# Altium project STM32N6 ETHERNET SWITCH.PrjPcb
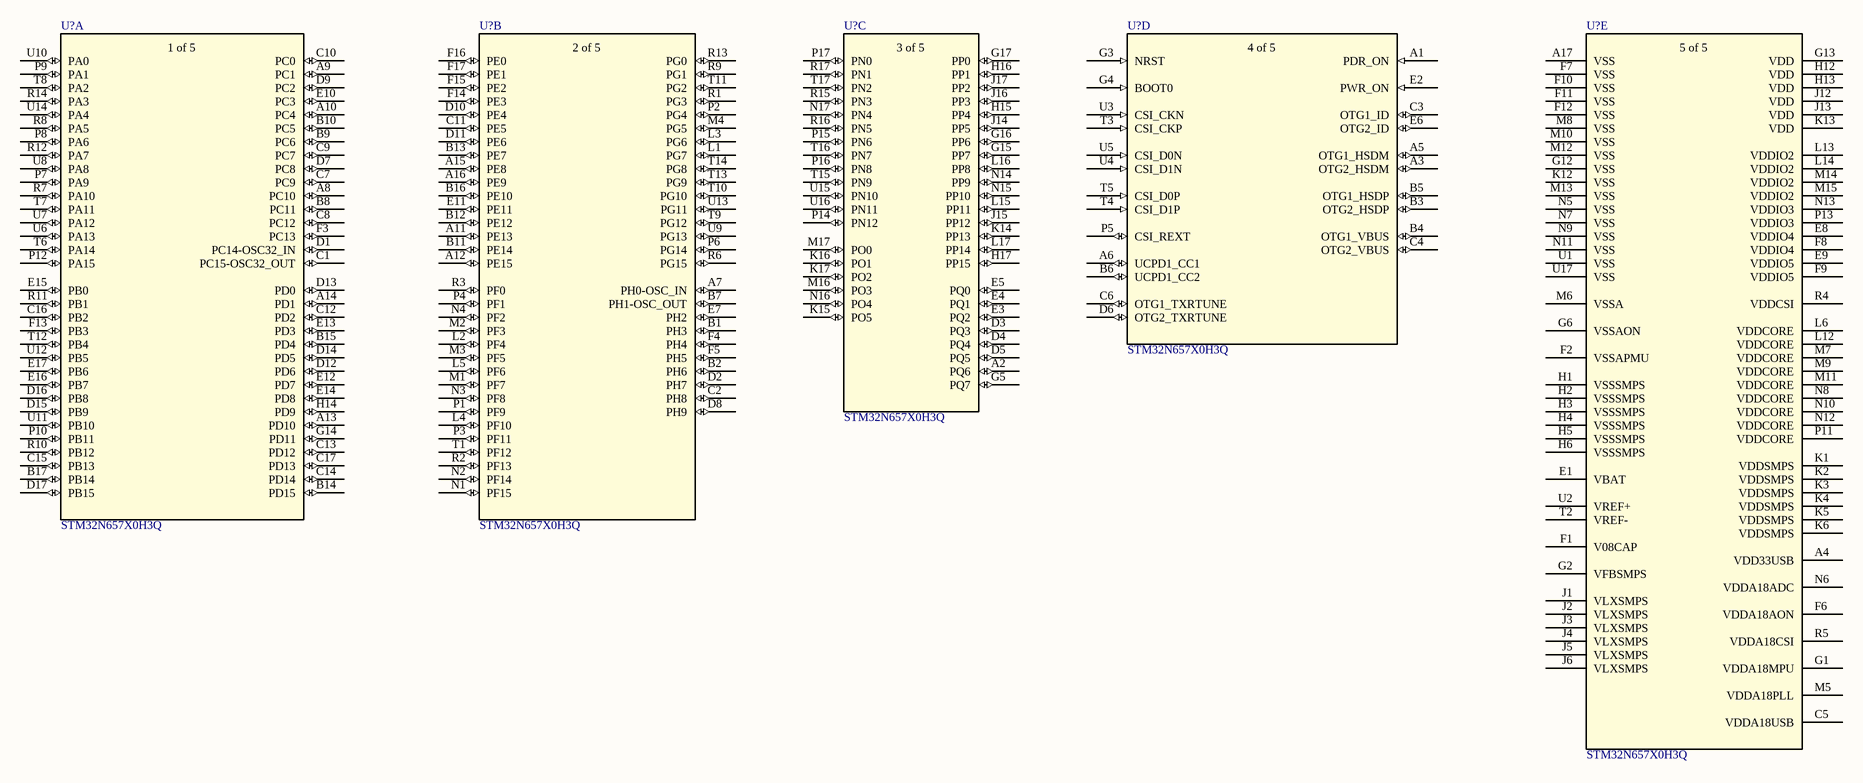
[diagram p0: MCU.SchDoc]
2 sheets, 13 parts. Net scope: global (net labels, ports and power ports of the same name join across sheets).
Sheets:
  MCU.SchDoc
  Ethernet Switch.SchDoc

## Sheet MCU.SchDoc
size A3; SheetNumber: 1; SheetTotal: 1

### Parts
(Parts that share a designator on the sheet are numbered #1, #2 ... from top to bottom, then left to right.)
U?#1  STM32N657X0H3Q  [VFBGA264_14X14_STM]  (part A of 5)
U?#2  STM32N657X0H3Q  [VFBGA264_14X14_STM]  (part B of 5)
U?#3  STM32N657X0H3Q  [VFBGA264_14X14_STM]  (part C of 5)
U?#4  STM32N657X0H3Q  [VFBGA264_14X14_STM]  (part D of 5)
U?#5  STM32N657X0H3Q  [VFBGA264_14X14_STM]  (part E of 5)

### Nets

Not connected (* = marked no-connect by the designer): U?#1 A8(PC10) A9(PC1) A10(PC4) A13(PD10) A14(PD1) B8(PC11) B9(PC6) B10(PC5) B14(PD15) B15(PD4) B17(PB14) C1(PC15-OSC32_OUT) C7(PC9) C8(PC12) C9(PC7) C10(PC0) C12(PD2) C13(PD12) C14(PD14) C15(PB13) C16(PB2) C17(PD13) D1(PC14-OSC32_IN) D7(PC8) D9(PC2) D12(PD6) D13(PD0) D14(PD5) D15(PB9) D16(PB8) D17(PB15) E10(PC3) E12(PD7) E13(PD3) E14(PD8) E15(PB0) E16(PB7) E17(PB6) F3(PC13) F13(PB3) G14(PD11) H14(PD9) P7(PA9) P8(PA6) P9(PA1) P10(PB11) P12(PA15) R7(PA10) R8(PA5) R10(PB12) R11(PB1) R12(PA7) R14(PA3) T6(PA14) T7(PA11) T8(PA2) T12(PB4) U6(PA13) U7(PA12) U8(PA8) U10(PA0) U11(PB10) U12(PB5) U14(PA4); U?#2 A7(PH0-OSC_IN) A11(PE13) A12(PE15) A15(PE8) A16(PE9) B1(PH3) B2(PH6) B7(PH1-OSC_OUT) B11(PE14) B12(PE12) B13(PE7) B16(PE10) C2(PH8) C11(PE5) D2(PH7) D8(PH9) D10(PE4) D11(PE6) E7(PH2) E11(PE11) F4(PH4) F5(PH5) F14(PE3) F15(PE2) F16(PE0) F17(PE1) L1(PG7) L2(PF4) L3(PG6) L4(PF10) L5(PF6) M1(PF7) M2(PF3) M3(PF5) M4(PG5) N1(PF15) N2(PF14) N3(PF8) N4(PF2) P1(PF9) P2(PG4) P3(PF11) P4(PF1) P6(PG14) R1(PG3) R2(PF13) R3(PF0) R6(PG15) R9(PG1) R13(PG0) T1(PF12) T9(PG12) T10(PG10) T11(PG2) T13(PG9) T14(PG8) U9(PG13) U13(PG11); U?#3 A2(PQ6) D3(PQ3) D4(PQ4) D5(PQ5) E3(PQ2) E4(PQ1) E5(PQ0) G5(PQ7) G15(PP7) G16(PP6) G17(PP0) H15(PP4) H16(PP1) H17(PP15) J14(PP5) J15(PP12) J16(PP3) J17(PP2) K14(PP13) K15(PO5) K16(PO1) K17(PO2) L15(PP11) L16(PP8) L17(PP14) M16(PO3) M17(PO0) N14(PP9) N15(PP10) N16(PO4) N17(PN4) P14(PN12) P15(PN6) P16(PN8) P17(PN0) R15(PN3) R16(PN5) R17(PN1) T15(PN9) T16(PN7) T17(PN2) U15(PN10) U16(PN11); U?#4 A1(PDR_ON) A3(OTG2_HSDM) A5(OTG1_HSDM) A6(UCPD1_CC1) B3(OTG2_HSDP) B4(OTG1_VBUS) B5(OTG1_HSDP) B6(UCPD1_CC2) C3(OTG1_ID) C4(OTG2_VBUS) C6(OTG1_TXRTUNE) D6(OTG2_TXRTUNE) E2(PWR_ON) E6(OTG2_ID) G3(NRST) G4(BOOT0) P5(CSI_REXT) T3(CSI_CKP) T4(CSI_D1P) T5(CSI_D0P) U3(CSI_CKN) U4(CSI_D1N) U5(CSI_D0N); U?#5 A4(VDD33USB) A17(VSS) C5(VDDA18USB) E1(VBAT) E8(VDDIO4) E9(VDDIO5) F1(V08CAP) F2(VSSAPMU) F6(VDDA18AON) F7(VSS) F8(VDDIO4) F9(VDDIO5) F10(VSS) F11(VSS) F12(VSS) G1(VDDA18MPU) G2(VFBSMPS) G6(VSSAON) G12(VSS) G13(VDD) H1(VSSSMPS) H2(VSSSMPS) H3(VSSSMPS) H4(VSSSMPS) H5(VSSSMPS) H6(VSSSMPS) H12(VDD) H13(VDD) J1(VLXSMPS) J2(VLXSMPS) J3(VLXSMPS) J4(VLXSMPS) J5(VLXSMPS) J6(VLXSMPS) J12(VDD) J13(VDD) K1(VDDSMPS) K2(VDDSMPS) K3(VDDSMPS) K4(VDDSMPS) K5(VDDSMPS) K6(VDDSMPS) K12(VSS) K13(VDD) L6(VDDCORE) L12(VDDCORE) L13(VDDIO2) L14(VDDIO2) M5(VDDA18PLL) M6(VSSA) M7(VDDCORE) M8(VSS) M9(VDDCORE) M10(VSS) M11(VDDCORE) M12(VSS) M13(VSS) M14(VDDIO2) M15(VDDIO2) N5(VSS) N6(VDDA18ADC) N7(VSS) N8(VDDCORE) N9(VSS) N10(VDDCORE) N11(VSS) N12(VDDCORE) N13(VDDIO3) P11(VDDCORE) P13(VDDIO3) R4(VDDCSI) R5(VDDA18CSI) T2(VREF-) U1(VSS) U2(VREF+) U17(VSS)

### Library data of the parts
U?#1-U?#5 = STM32N657X0H3Q: High performance Arm Cortex-M55 MCU, 800MHz, 4.2MB SRAM, Neural-ART accelerator 600 GOPS, NeoChrom GPU, JPEG Codec, H-264 enc, HW crypto; Manufacturer_Name: STMicroelectronics; Copyright: Copyright (C) 2025 Ultra Librarian. All rights reserved.; Manufacturer_Part_Number: STM32N657X0H3Q; Datasheet: https://www.st.com/resource/en/datasheet/stm32n657a0.pdf; RefDes: RefDes; Type: Type

## Sheet Ethernet Switch.SchDoc
size A1; SheetNumber: 2; SheetTotal: 2
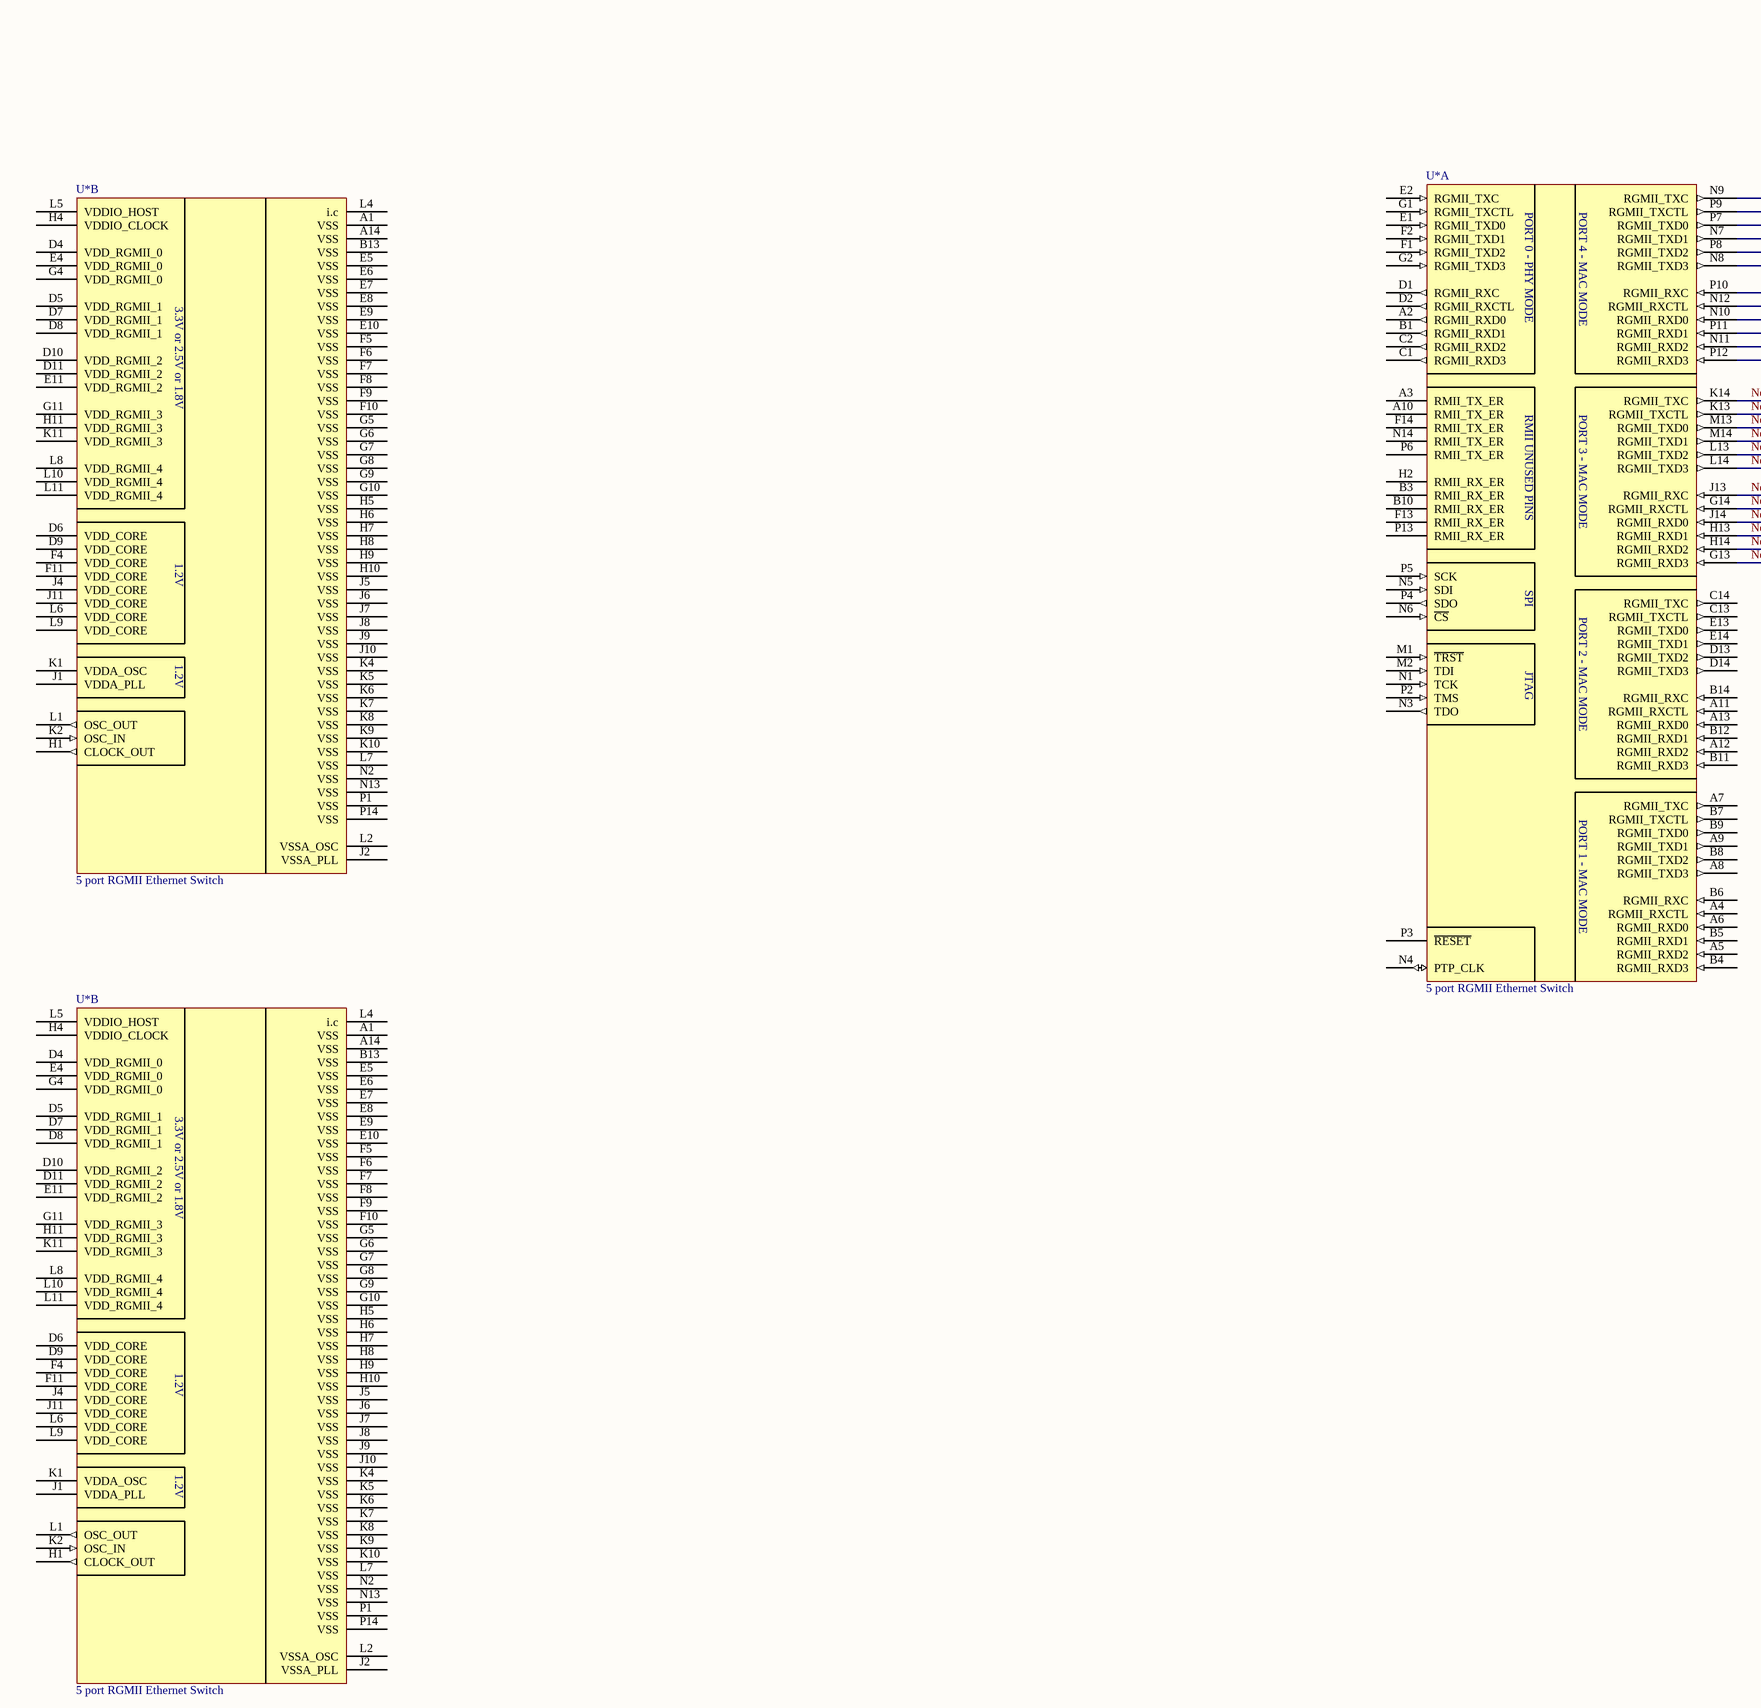
[diagram p1: Ethernet Switch.SchDoc, top left]
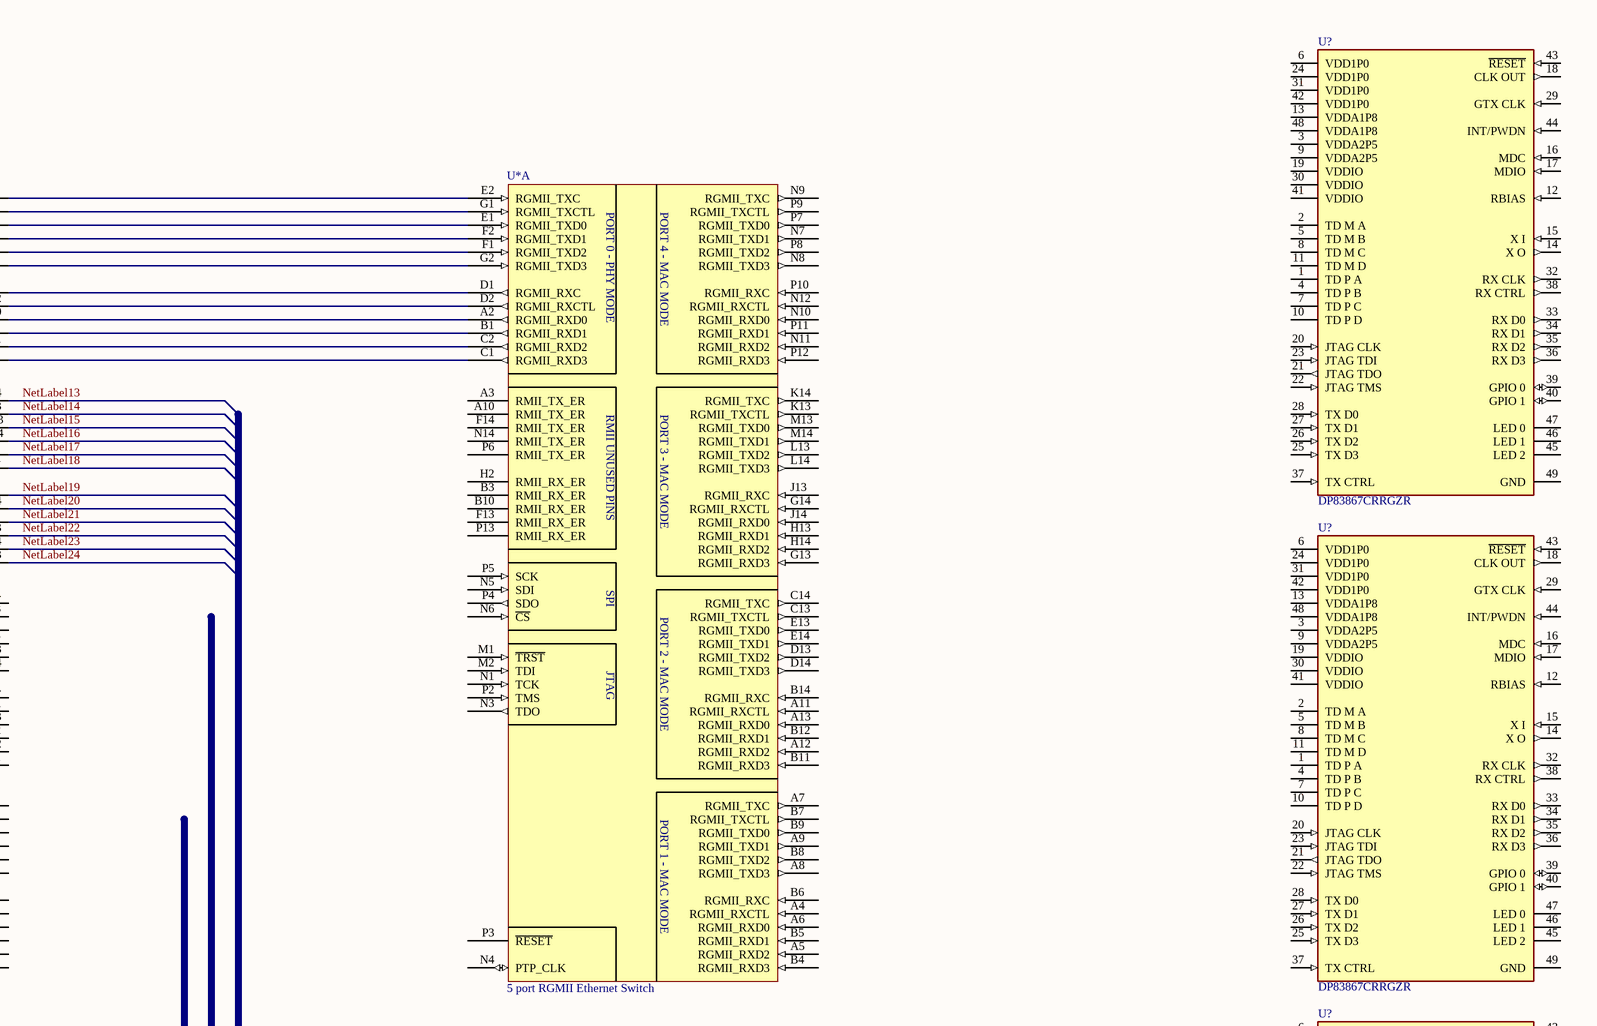
[diagram p2: Ethernet Switch.SchDoc, top right]
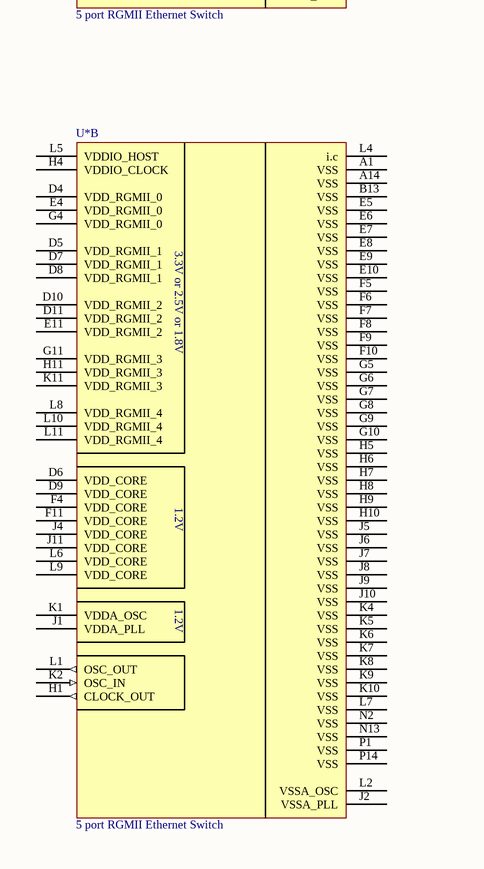
[diagram p3: Ethernet Switch.SchDoc, bottom left]
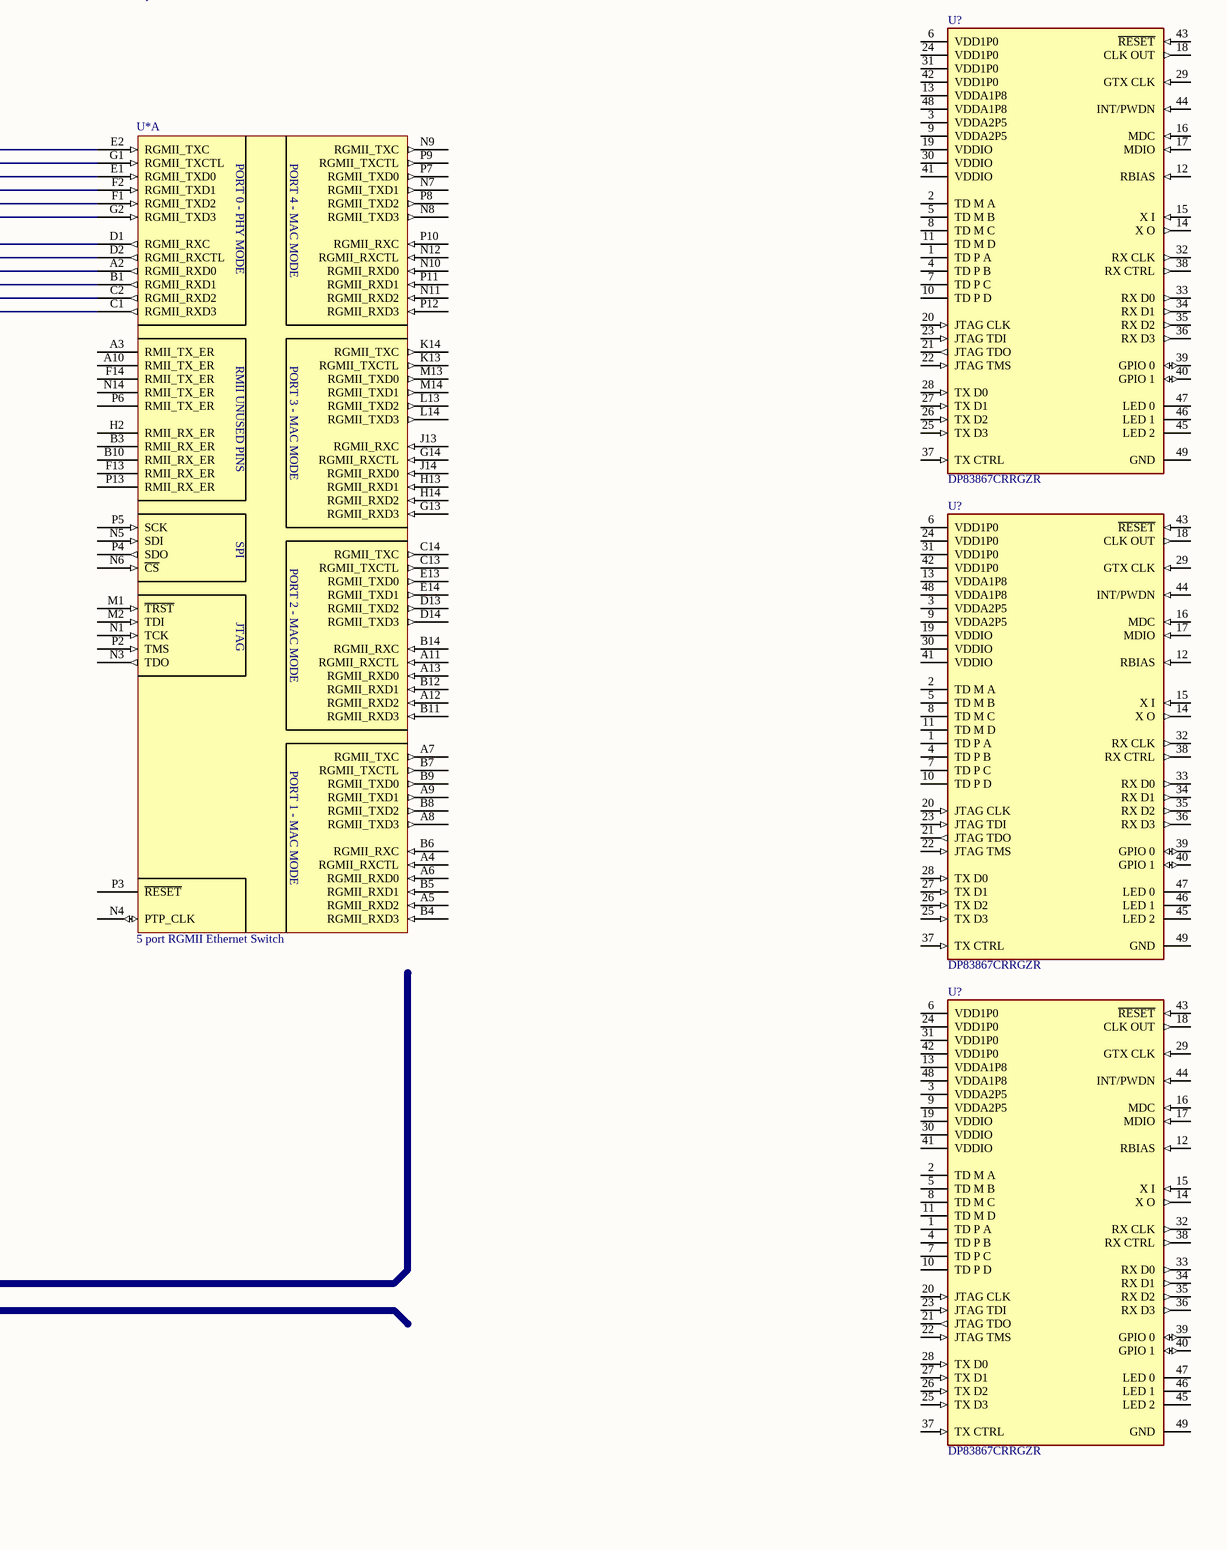
[diagram p4: Ethernet Switch.SchDoc, bottom right]

### Parts
(Parts that share a designator on the sheet are numbered #1, #2 ... from top to bottom, then left to right.)
U*#1  5 port RGMII Ethernet Switch  (parts A,B of 2)
U*#2  5 port RGMII Ethernet Switch  (parts A,B of 2)
U*#3  5 port RGMII Ethernet Switch  (parts A,B of 2)
U?#6  DP83867CRRGZR  [FP-RGZ0048B-IPC_A]
U?#7  DP83867CRRGZR  [FP-RGZ0048B-IPC_A]
U?#8  DP83867CRRGZR  [FP-RGZ0048B-IPC_A]
U?#9  DP83867CRRGZR  [FP-RGZ0048B-IPC_A]
U?#10  DP83867CRRGZR  [FP-RGZ0048B-IPC_A]

### Nets
NetLabel13: U*#1.K14(RGMII_TXC)
NetLabel14: U*#1.K13(RGMII_TXCTL)
NetLabel15: U*#1.M13(RGMII_TXD0)
NetLabel16: U*#1.M14(RGMII_TXD1)
NetLabel17: U*#1.L13(RGMII_TXD2)
NetLabel18: U*#1.L14(RGMII_TXD3)
NetLabel19: U*#1.J13(RGMII_RXC)
NetLabel20: U*#1.G14(RGMII_RXCTL)
NetLabel21: U*#1.J14(RGMII_RXD0)
NetLabel22: U*#1.H13(RGMII_RXD1)
NetLabel23: U*#1.H14(RGMII_RXD2)
NetLabel24: U*#1.G13(RGMII_RXD3)
NetU*#1_N7: U*#1.N7(RGMII_TXD1) U*#2.F2(RGMII_TXD1)
NetU*#1_N8: U*#1.N8(RGMII_TXD3) U*#2.G2(RGMII_TXD3)
NetU*#1_N9: U*#1.N9(RGMII_TXC) U*#2.E2(RGMII_TXC)
NetU*#1_N10: U*#1.N10(RGMII_RXD0) U*#2.A2(RGMII_RXD0)
NetU*#1_N11: U*#1.N11(RGMII_RXD2) U*#2.C2(RGMII_RXD2)
NetU*#1_N12: U*#1.N12(RGMII_RXCTL) U*#2.D2(RGMII_RXCTL)
NetU*#1_P7: U*#1.P7(RGMII_TXD0) U*#2.E1(RGMII_TXD0)
NetU*#1_P8: U*#1.P8(RGMII_TXD2) U*#2.F1(RGMII_TXD2)
NetU*#1_P9: U*#1.P9(RGMII_TXCTL) U*#2.G1(RGMII_TXCTL)
NetU*#1_P10: U*#1.P10(RGMII_RXC) U*#2.D1(RGMII_RXC)
NetU*#1_P11: U*#1.P11(RGMII_RXD1) U*#2.B1(RGMII_RXD1)
NetU*#1_P12: U*#1.P12(RGMII_RXD3) U*#2.C1(RGMII_RXD3)

Not connected (* = marked no-connect by the designer): U*#1 A1(VSS) A2(RGMII_RXD0) A3(RMII_TX_ER) A4(RGMII_RXCTL) A5(RGMII_RXD2) A6(RGMII_RXD0) A7(RGMII_TXC) A8(RGMII_TXD3) A9(RGMII_TXD1) A10(RMII_TX_ER) A11(RGMII_RXCTL) A12(RGMII_RXD2) A13(RGMII_RXD0) A14(VSS) B1(RGMII_RXD1) B3(RMII_RX_ER) B4(RGMII_RXD3) B5(RGMII_RXD1) B6(RGMII_RXC) B7(RGMII_TXCTL) B8(RGMII_TXD2) B9(RGMII_TXD0) B10(RMII_RX_ER) B11(RGMII_RXD3) B12(RGMII_RXD1) B13(VSS) B14(RGMII_RXC) C1(RGMII_RXD3) C2(RGMII_RXD2) C13(RGMII_TXCTL) C14(RGMII_TXC) D1(RGMII_RXC) D2(RGMII_RXCTL) D4(VDD_RGMII_0) D5(VDD_RGMII_1) D6(VDD_CORE) D7(VDD_RGMII_1) D8(VDD_RGMII_1) D9(VDD_CORE) D10(VDD_RGMII_2) D11(VDD_RGMII_2) D13(RGMII_TXD2) D14(RGMII_TXD3) E1(RGMII_TXD0) E2(RGMII_TXC) E4(VDD_RGMII_0) E5(VSS) E6(VSS) E7(VSS) E8(VSS) E9(VSS) E10(VSS) E11(VDD_RGMII_2) E13(RGMII_TXD0) E14(RGMII_TXD1) F1(RGMII_TXD2) F2(RGMII_TXD1) F4(VDD_CORE) F5(VSS) F6(VSS) F7(VSS) F8(VSS) F9(VSS) F10(VSS) F11(VDD_CORE) F13(RMII_RX_ER) F14(RMII_TX_ER) G1(RGMII_TXCTL) G2(RGMII_TXD3) G4(VDD_RGMII_0) G5(VSS) G6(VSS) G7(VSS) G8(VSS) G9(VSS) G10(VSS) G11(VDD_RGMII_3) H1(CLOCK_OUT) H2(RMII_RX_ER) H4(VDDIO_CLOCK) H5(VSS) H6(VSS) H7(VSS) H8(VSS) H9(VSS) H10(VSS) H11(VDD_RGMII_3) J1(VDDA_PLL) J2(VSSA_PLL) J4(VDD_CORE) J5(VSS) J6(VSS) J7(VSS) J8(VSS) J9(VSS) J10(VSS) J11(VDD_CORE) K1(VDDA_OSC) K2(OSC_IN) K4(VSS) K5(VSS) K6(VSS) K7(VSS) K8(VSS) K9(VSS) K10(VSS) K11(VDD_RGMII_3) L1(OSC_OUT) L2(VSSA_OSC) L4(i.c) L5(VDDIO_HOST) L6(VDD_CORE) L7(VSS) L8(VDD_RGMII_4) L9(VDD_CORE) L10(VDD_RGMII_4) L11(VDD_RGMII_4) M1(~{TRST}) M2(TDI) N1(TCK) N2(VSS) N3(TDO) N4(PTP_CLK) N5(SDI) N6(~{CS}) N13(VSS) N14(RMII_TX_ER) P1(VSS) P2(TMS) P3(~{RESET}) P4(SDO) P5(SCK) P6(RMII_TX_ER) P13(RMII_RX_ER) P14(VSS); U*#2 A1(VSS) A3(RMII_TX_ER) A4(RGMII_RXCTL) A5(RGMII_RXD2) A6(RGMII_RXD0) A7(RGMII_TXC) A8(RGMII_TXD3) A9(RGMII_TXD1) A10(RMII_TX_ER) A11(RGMII_RXCTL) A12(RGMII_RXD2) A13(RGMII_RXD0) A14(VSS) B3(RMII_RX_ER) B4(RGMII_RXD3) B5(RGMII_RXD1) B6(RGMII_RXC) B7(RGMII_TXCTL) B8(RGMII_TXD2) B9(RGMII_TXD0) B10(RMII_RX_ER) B11(RGMII_RXD3) B12(RGMII_RXD1) B13(VSS) B14(RGMII_RXC) C13(RGMII_TXCTL) C14(RGMII_TXC) D4(VDD_RGMII_0) D5(VDD_RGMII_1) D6(VDD_CORE) D7(VDD_RGMII_1) D8(VDD_RGMII_1) D9(VDD_CORE) D10(VDD_RGMII_2) D11(VDD_RGMII_2) D13(RGMII_TXD2) D14(RGMII_TXD3) E4(VDD_RGMII_0) E5(VSS) E6(VSS) E7(VSS) E8(VSS) E9(VSS) E10(VSS) E11(VDD_RGMII_2) E13(RGMII_TXD0) E14(RGMII_TXD1) F4(VDD_CORE) F5(VSS) F6(VSS) F7(VSS) F8(VSS) F9(VSS) F10(VSS) F11(VDD_CORE) F13(RMII_RX_ER) F14(RMII_TX_ER) G4(VDD_RGMII_0) G5(VSS) G6(VSS) G7(VSS) G8(VSS) G9(VSS) G10(VSS) G11(VDD_RGMII_3) G13(RGMII_RXD3) G14(RGMII_RXCTL) H1(CLOCK_OUT) H2(RMII_RX_ER) H4(VDDIO_CLOCK) H5(VSS) H6(VSS) H7(VSS) H8(VSS) H9(VSS) H10(VSS) H11(VDD_RGMII_3) H13(RGMII_RXD1) H14(RGMII_RXD2) J1(VDDA_PLL) J2(VSSA_PLL) J4(VDD_CORE) J5(VSS) J6(VSS) J7(VSS) J8(VSS) J9(VSS) J10(VSS) J11(VDD_CORE) J13(RGMII_RXC) J14(RGMII_RXD0) K1(VDDA_OSC) K2(OSC_IN) K4(VSS) K5(VSS) K6(VSS) K7(VSS) K8(VSS) K9(VSS) K10(VSS) K11(VDD_RGMII_3) K13(RGMII_TXCTL) K14(RGMII_TXC) L1(OSC_OUT) L2(VSSA_OSC) L4(i.c) L5(VDDIO_HOST) L6(VDD_CORE) L7(VSS) L8(VDD_RGMII_4) L9(VDD_CORE) L10(VDD_RGMII_4) L11(VDD_RGMII_4) L13(RGMII_TXD2) L14(RGMII_TXD3) M1(~{TRST}) M2(TDI) M13(RGMII_TXD0) M14(RGMII_TXD1) N1(TCK) N2(VSS) N3(TDO) N4(PTP_CLK) N5(SDI) N6(~{CS}) N7(RGMII_TXD1) N8(RGMII_TXD3) N9(RGMII_TXC) N10(RGMII_RXD0) N11(RGMII_RXD2) N12(RGMII_RXCTL) N13(VSS) N14(RMII_TX_ER) P1(VSS) P2(TMS) P3(~{RESET}) P4(SDO) P5(SCK) P6(RMII_TX_ER) P7(RGMII_TXD0) P8(RGMII_TXD2) P9(RGMII_TXCTL) P10(RGMII_RXC) P11(RGMII_RXD1) P12(RGMII_RXD3) P13(RMII_RX_ER) P14(VSS); U*#3 A1(VSS) A2(RGMII_RXD0) A3(RMII_TX_ER) A4(RGMII_RXCTL) A5(RGMII_RXD2) A6(RGMII_RXD0) A7(RGMII_TXC) A8(RGMII_TXD3) A9(RGMII_TXD1) A10(RMII_TX_ER) A11(RGMII_RXCTL) A12(RGMII_RXD2) A13(RGMII_RXD0) A14(VSS) B1(RGMII_RXD1) B3(RMII_RX_ER) B4(RGMII_RXD3) B5(RGMII_RXD1) B6(RGMII_RXC) B7(RGMII_TXCTL) B8(RGMII_TXD2) B9(RGMII_TXD0) B10(RMII_RX_ER) B11(RGMII_RXD3) B12(RGMII_RXD1) B13(VSS) B14(RGMII_RXC) C1(RGMII_RXD3) C2(RGMII_RXD2) C13(RGMII_TXCTL) C14(RGMII_TXC) D1(RGMII_RXC) D2(RGMII_RXCTL) D4(VDD_RGMII_0) D5(VDD_RGMII_1) D6(VDD_CORE) D7(VDD_RGMII_1) D8(VDD_RGMII_1) D9(VDD_CORE) D10(VDD_RGMII_2) D11(VDD_RGMII_2) D13(RGMII_TXD2) D14(RGMII_TXD3) E1(RGMII_TXD0) E2(RGMII_TXC) E4(VDD_RGMII_0) E5(VSS) E6(VSS) E7(VSS) E8(VSS) E9(VSS) E10(VSS) E11(VDD_RGMII_2) E13(RGMII_TXD0) E14(RGMII_TXD1) F1(RGMII_TXD2) F2(RGMII_TXD1) F4(VDD_CORE) F5(VSS) F6(VSS) F7(VSS) F8(VSS) F9(VSS) F10(VSS) F11(VDD_CORE) F13(RMII_RX_ER) F14(RMII_TX_ER) G1(RGMII_TXCTL) G2(RGMII_TXD3) G4(VDD_RGMII_0) G5(VSS) G6(VSS) G7(VSS) G8(VSS) G9(VSS) G10(VSS) G11(VDD_RGMII_3) G13(RGMII_RXD3) G14(RGMII_RXCTL) H1(CLOCK_OUT) H2(RMII_RX_ER) H4(VDDIO_CLOCK) H5(VSS) H6(VSS) H7(VSS) H8(VSS) H9(VSS) H10(VSS) H11(VDD_RGMII_3) H13(RGMII_RXD1) H14(RGMII_RXD2) J1(VDDA_PLL) J2(VSSA_PLL) J4(VDD_CORE) J5(VSS) J6(VSS) J7(VSS) J8(VSS) J9(VSS) J10(VSS) J11(VDD_CORE) J13(RGMII_RXC) J14(RGMII_RXD0) K1(VDDA_OSC) K2(OSC_IN) K4(VSS) K5(VSS) K6(VSS) K7(VSS) K8(VSS) K9(VSS) K10(VSS) K11(VDD_RGMII_3) K13(RGMII_TXCTL) K14(RGMII_TXC) L1(OSC_OUT) L2(VSSA_OSC) L4(i.c) L5(VDDIO_HOST) L6(VDD_CORE) L7(VSS) L8(VDD_RGMII_4) L9(VDD_CORE) L10(VDD_RGMII_4) L11(VDD_RGMII_4) L13(RGMII_TXD2) L14(RGMII_TXD3) M1(~{TRST}) M2(TDI) M13(RGMII_TXD0) M14(RGMII_TXD1) N1(TCK) N2(VSS) N3(TDO) N4(PTP_CLK) N5(SDI) N6(~{CS}) N7(RGMII_TXD1) N8(RGMII_TXD3) N9(RGMII_TXC) N10(RGMII_RXD0) N11(RGMII_RXD2) N12(RGMII_RXCTL) N13(VSS) N14(RMII_TX_ER) P1(VSS) P2(TMS) P3(~{RESET}) P4(SDO) P5(SCK) P6(RMII_TX_ER) P7(RGMII_TXD0) P8(RGMII_TXD2) P9(RGMII_TXCTL) P10(RGMII_RXC) P11(RGMII_RXD1) P12(RGMII_RXD3) P13(RMII_RX_ER) P14(VSS); U?#6 1(TD_P_A) 2(TD_M_A) 3(VDDA2P5) 4(TD_P_B) 5(TD_M_B) 6(VDD1P0) 7(TD_P_C) 8(TD_M_C) 9(VDDA2P5) 10(TD_P_D) 11(TD_M_D) 12(RBIAS) 13(VDDA1P8) 14(X_O) 15(X_I) 16(MDC) 17(MDIO) 18(CLK_OUT) 19(VDDIO) 20(JTAG_CLK) 21(JTAG_TDO) 22(JTAG_TMS) 23(JTAG_TDI) 24(VDD1P0) 25(TX_D3) 26(TX_D2) 27(TX_D1) 28(TX_D0) 29(GTX_CLK) 30(VDDIO) 31(VDD1P0) 32(RX_CLK) 33(RX_D0) 34(RX_D1) 35(RX_D2) 36(RX_D3) 37(TX_CTRL) 38(RX_CTRL) 39(GPIO_0) 40(GPIO_1) 41(VDDIO) 42(VDD1P0) 43(~{RESET}) 44(INT/PWDN) 45(LED_2) 46(LED_1) 47(LED_0) 48(VDDA1P8) 49(GND); U?#7 1(TD_P_A) 2(TD_M_A) 3(VDDA2P5) 4(TD_P_B) 5(TD_M_B) 6(VDD1P0) 7(TD_P_C) 8(TD_M_C) 9(VDDA2P5) 10(TD_P_D) 11(TD_M_D) 12(RBIAS) 13(VDDA1P8) 14(X_O) 15(X_I) 16(MDC) 17(MDIO) 18(CLK_OUT) 19(VDDIO) 20(JTAG_CLK) 21(JTAG_TDO) 22(JTAG_TMS) 23(JTAG_TDI) 24(VDD1P0) 25(TX_D3) 26(TX_D2) 27(TX_D1) 28(TX_D0) 29(GTX_CLK) 30(VDDIO) 31(VDD1P0) 32(RX_CLK) 33(RX_D0) 34(RX_D1) 35(RX_D2) 36(RX_D3) 37(TX_CTRL) 38(RX_CTRL) 39(GPIO_0) 40(GPIO_1) 41(VDDIO) 42(VDD1P0) 43(~{RESET}) 44(INT/PWDN) 45(LED_2) 46(LED_1) 47(LED_0) 48(VDDA1P8) 49(GND); U?#8 1(TD_P_A) 2(TD_M_A) 3(VDDA2P5) 4(TD_P_B) 5(TD_M_B) 6(VDD1P0) 7(TD_P_C) 8(TD_M_C) 9(VDDA2P5) 10(TD_P_D) 11(TD_M_D) 12(RBIAS) 13(VDDA1P8) 14(X_O) 15(X_I) 16(MDC) 17(MDIO) 18(CLK_OUT) 19(VDDIO) 20(JTAG_CLK) 21(JTAG_TDO) 22(JTAG_TMS) 23(JTAG_TDI) 24(VDD1P0) 25(TX_D3) 26(TX_D2) 27(TX_D1) 28(TX_D0) 29(GTX_CLK) 30(VDDIO) 31(VDD1P0) 32(RX_CLK) 33(RX_D0) 34(RX_D1) 35(RX_D2) 36(RX_D3) 37(TX_CTRL) 38(RX_CTRL) 39(GPIO_0) 40(GPIO_1) 41(VDDIO) 42(VDD1P0) 43(~{RESET}) 44(INT/PWDN) 45(LED_2) 46(LED_1) 47(LED_0) 48(VDDA1P8) 49(GND); U?#9 1(TD_P_A) 2(TD_M_A) 3(VDDA2P5) 4(TD_P_B) 5(TD_M_B) 6(VDD1P0) 7(TD_P_C) 8(TD_M_C) 9(VDDA2P5) 10(TD_P_D) 11(TD_M_D) 12(RBIAS) 13(VDDA1P8) 14(X_O) 15(X_I) 16(MDC) 17(MDIO) 18(CLK_OUT) 19(VDDIO) 20(JTAG_CLK) 21(JTAG_TDO) 22(JTAG_TMS) 23(JTAG_TDI) 24(VDD1P0) 25(TX_D3) 26(TX_D2) 27(TX_D1) 28(TX_D0) 29(GTX_CLK) 30(VDDIO) 31(VDD1P0) 32(RX_CLK) 33(RX_D0) 34(RX_D1) 35(RX_D2) 36(RX_D3) 37(TX_CTRL) 38(RX_CTRL) 39(GPIO_0) 40(GPIO_1) 41(VDDIO) 42(VDD1P0) 43(~{RESET}) 44(INT/PWDN) 45(LED_2) 46(LED_1) 47(LED_0) 48(VDDA1P8) 49(GND); U?#10 1(TD_P_A) 2(TD_M_A) 3(VDDA2P5) 4(TD_P_B) 5(TD_M_B) 6(VDD1P0) 7(TD_P_C) 8(TD_M_C) 9(VDDA2P5) 10(TD_P_D) 11(TD_M_D) 12(RBIAS) 13(VDDA1P8) 14(X_O) 15(X_I) 16(MDC) 17(MDIO) 18(CLK_OUT) 19(VDDIO) 20(JTAG_CLK) 21(JTAG_TDO) 22(JTAG_TMS) 23(JTAG_TDI) 24(VDD1P0) 25(TX_D3) 26(TX_D2) 27(TX_D1) 28(TX_D0) 29(GTX_CLK) 30(VDDIO) 31(VDD1P0) 32(RX_CLK) 33(RX_D0) 34(RX_D1) 35(RX_D2) 36(RX_D3) 37(TX_CTRL) 38(RX_CTRL) 39(GPIO_0) 40(GPIO_1) 41(VDDIO) 42(VDD1P0) 43(~{RESET}) 44(INT/PWDN) 45(LED_2) 46(LED_1) 47(LED_0) 48(VDDA1P8) 49(GND)

### Notes on the sheet
- (in symbol SJA1105QELY, part A) PORT 0 - PHY MODE; PORT 4 - MAC MODE; RMII UNUSED PINS; PORT 3 - MAC MODE; SPI; PORT 2 - MAC MODE; JTAG; PORT 1 - MAC MODE
- (in symbol SJA1105QELY, part B) 3.3V or 2.5V or 1.8V; 1.2V

### Library data of the parts
U*#1-U*#3 = SJA1105QELY
U?#6-U?#10 = CMP-04874-000031-1: IC CONTROLLER ETHERNET 48VQFN; Interface: Serial; Cable Length: 130m; Operating Supply Current: 157mA; Max Operating Temperature: 70°C; Case/Package: VQFN; RoHS Compliant: Yes; Packaging: Tape and Reel; Min Operating Temperature: 0°C; Lead Free: Lead Free